# Altium schematic sheet esp32c5.SchDoc
size B; SheetNumber: 1; SheetTotal: 5
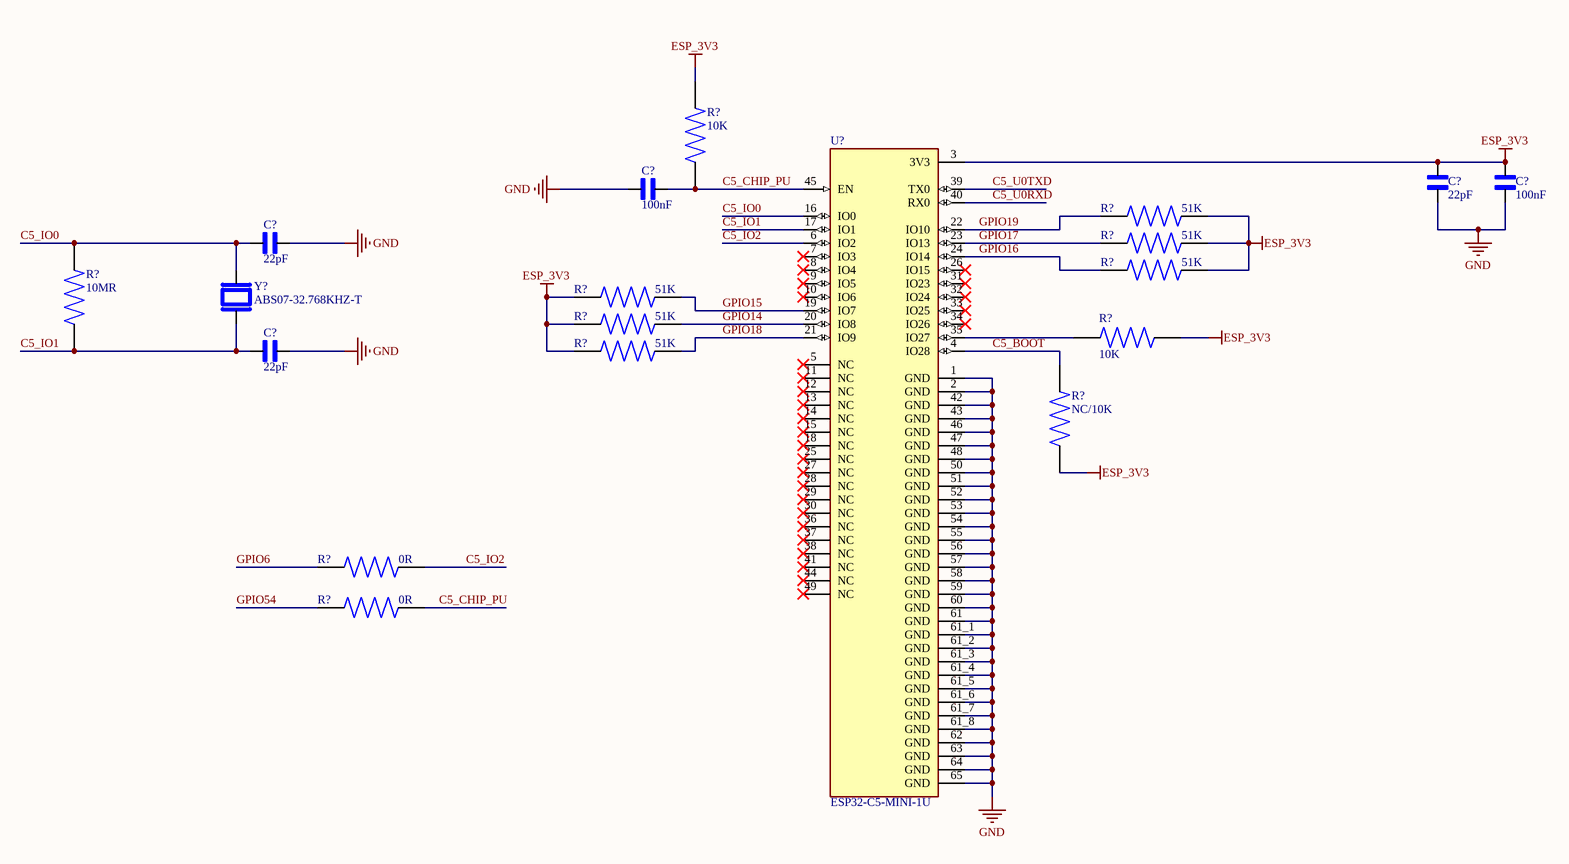
[diagram p0: esp32c5.SchDoc]

## Parts
(Parts that share a designator on the sheet are numbered #1, #2 ... from top to bottom, then left to right.)
C?#1  100nF  [CAPC1005X61N]
C?#2  22pF  [CAPC1005X61N]
C?#3  100nF  [CAPC1005X61N]
C?#4  22pF  [CAPC1005X61N]
C?#5  22pF  [CAPC1005X61N]
R?#1  10K  [RES_ERJU02F5102X]
R?#2  51K  [RES_ERJU02F5102X]
R?#3  51K  [RES_ERJU02F5102X]
R?#4  51K  [RES_ERJU02F5102X]
R?#5  10MR  [RES_ERJU02F5102X]
R?#6  51K  [RES_ERJU02F5102X]
R?#7  51K  [RES_ERJU02F5102X]
R?#8  10K  [RES_ERJU02F5102X]
R?#9  51K  [RES_ERJU02F5102X]
R?#10  NC/10K  [RES_ERJU02F5102X]
R?#11  0R  [RES_ERJU02F5102X]
R?#12  0R  [RES_ERJU02F5102X]
U?  ESP32-C5-MINI-1U  [ESP32-C5-MINI-1U]
Y?  ABS07-32.768KHZ-T  [XTAL_ABS07-32.768KHZ-T]

## Nets
ESP_3V3: C?#2.2 C?#3.2 R?#1.1 R?#2.2 R?#3.2 R?#4.2 R?#6.1 R?#7.1 R?#8.1 R?#9.1 R?#10.2 U?.3(3V3)
GND: C?#1.2 C?#2.1 C?#3.1 C?#4.2 C?#5.2 U?.1(GND) U?.2(GND) U?.42(GND) U?.43(GND) U?.46(GND) U?.47(GND) U?.48(GND) U?.50(GND) U?.51(GND) U?.52(GND) U?.53(GND) U?.54(GND) U?.55(GND) U?.56(GND) U?.57(GND) U?.58(GND) U?.59(GND) U?.60(GND) U?.61(GND) U?.61_1(GND) U?.61_2(GND) U?.61_3(GND) U?.61_4(GND) U?.61_5(GND) U?.61_6(GND) U?.61_7(GND) U?.61_8(GND) U?.62(GND) U?.63(GND) U?.64(GND) U?.65(GND)
C5_BOOT: R?#10.1 U?.4(IO28)
C5_CHIP_PU: C?#1.1 R?#1.2 R?#12.2 U?.45(EN)
C5_IO0: C?#4.1 R?#5.2 U?.16(IO0) Y?.2
C5_IO1: C?#5.1 R?#5.1 U?.17(IO1) Y?.1
C5_IO2: R?#11.2 U?.6(IO2)
C5_U0RXD: U?.40(RX0)
C5_U0TXD: U?.39(TX0)
GPIO6: R?#11.1
GPIO14: R?#7.2 U?.20(IO8)
GPIO15: R?#6.2 U?.19(IO7)
GPIO16: R?#4.1 U?.24(IO14)
GPIO17: R?#3.1 U?.23(IO13)
GPIO18: R?#9.2 U?.21(IO9)
GPIO19: R?#2.1 U?.22(IO10)
GPIO54: R?#12.1
NetR?#8_2: R?#8.2 U?.35(IO27)

Not connected (* = marked no-connect by the designer): U? 5(NC)* 7(IO3)* 8(IO4)* 9(IO5)* 10(IO6)* 11(NC)* 12(NC)* 13(NC)* 14(NC)* 15(NC)* 18(NC)* 25(NC)* 26(IO15)* 27(NC)* 28(NC)* 29(NC)* 30(NC)* 31(IO23)* 32(IO24)* 33(IO25)* 34(IO26)* 36(NC)* 37(NC)* 38(NC)* 41(NC)* 44(NC)* 49(NC)*

## Library data of the parts
C?#1-C?#5 = cap_0402_VJ0402D100MXCAP: cap 0402; MF: Vishay Vitramon; SnapEDA_Link: https://www.snapeda.com/parts/VJ0402D100MXCAP/Vishay/view-part/?ref=snap; Package: 1005 Vishay Vitramon; Value: *; MP: VJ0402D100MXCAP; Check_prices: https://www.snapeda.com/parts/VJ0402D100MXCAP/Vishay/view-part/?ref=eda
R?#1-R?#12 = res_0402_ERJU02F5102X: Availability: Unavailable; MP: ERJU02F5102X; Price: None; Package: None; Value: *
U? = ESP32-C5-MINI-1U: Compact Wi-Fi 6 and Bluetooth 5.0 LE wireless module based on the ESP32-C5 SoC, featuring a 32-bit RISC-V single-core processor up to 240 MHz, 4 MB SPI flash, 2.4 GHz and 5 GHz dual-band Wi-Fi, IEEE 802.15.4 (Thread/Zigbee), and an external antenna connector (U.FL/IPEX). Integrated GPIO, SPI, UART, I2C, ADC, PWM and other peripherals. Designed for IoT, wireless communication, smart devices and embedded applications.
Y? = ABS07-32.768KHZ-T: 32.768 kHz Â±20ppm Crystal 12.5pF 70 kOhms 2-SMD, No Lead; MF: Abracon; Availability: In Stock; SnapEDA_Link: https://www.snapeda.com/parts/ABS07-32.768KHZ-T/Abracon+LLC/view-part/?ref=snap; MP: ABS07-32.768KHZ-T; Price: None; Value: *; Check_prices: https://www.snapeda.com/parts/ABS07-32.768KHZ-T/Abracon+LLC/view-part/?ref=eda; Purchase-URL: https://pricing.snapeda.com/search/part/ABS07-32.768KHZ-T/?ref=eda; Package: SMD-2 Abracon LLC